# Altium schematic sheet board.SchDoc: Display & buttons board
size A3; Revision: 1; SheetNumber: 6; SheetTotal: 29
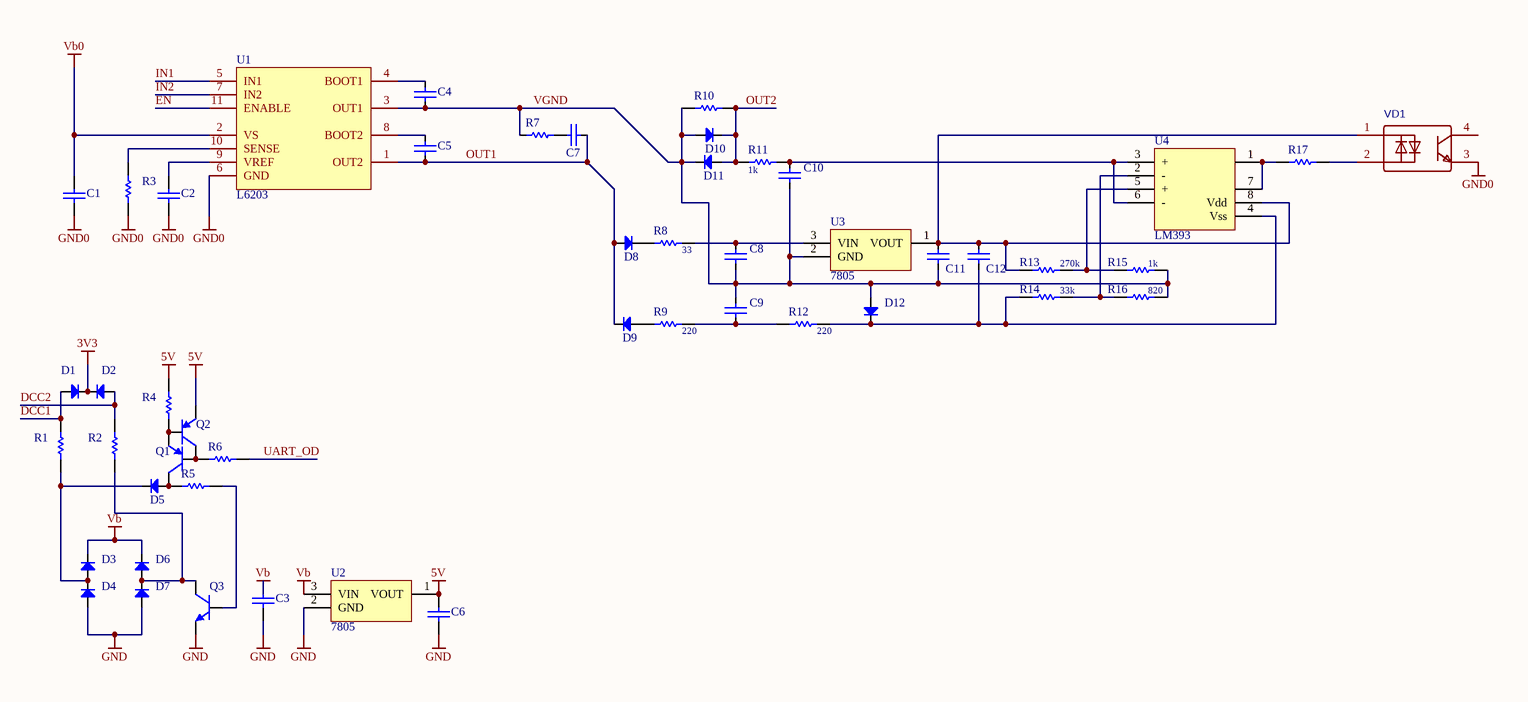
[diagram p0: board.SchDoc]

## Parts
C1  4n7  [C1210-2.5MM]  (value not drawn)
C2  4n7  [C0805]  (value not drawn)
C3  4n7  [C1210-2.5MM]  (value not drawn)
C4  15n  [C0805]  (value not drawn)
C5  15n  [C0805]  (value not drawn)
C6  4n7  [C1210-2.5MM]  (value not drawn)
C7  4n7  [C0805]  (value not drawn)
C8  2u  [C1210-1.8MM]  (value not drawn)
C9  2u  [C1210-1.8MM]  (value not drawn)
C10  100p  [C0603]  (value not drawn)
C11  10u  [C0805]  (value not drawn)
C12  10u  [C0805]  (value not drawn)
D1  1N4148WS  [SOD-323]  (value not drawn)
D2  1N4148WS  [SOD-323]  (value not drawn)
D3  1N4148WS  [SMA]  (value not drawn)
D4  1N4148WS  [SMA]  (value not drawn)
D5  1N4148WS  [SOD-323]  (value not drawn)
D6  1N4148WS  [SMA]  (value not drawn)
D7  1N4148WS  [SMA]  (value not drawn)
D8  1N4148WS  [SOD-323]  (value not drawn)
D9  1N4148WS  [SOD-323]  (value not drawn)
D10  SS36  [SMA]  (value not drawn)
D11  SS36  [SMA]  (value not drawn)
D12  1N4148WS  [SOD-323]  (value not drawn)
Q1  Bipolar PNP 3 Pins Transistor Gummel-Poon Model  [SOT-23]  (value not drawn)
Q2  Bipolar PNP 3 Pins Transistor Gummel-Poon Model  [SOT-23]  (value not drawn)
Q3  MMBT2222  [SOT-23]  (value not drawn)
R1  (no value)  [R0603]
R2  (no value)  [R0603]
R3  (no value)  [R1206]
R4  (no value)  [R0603]
R5  (no value)  [R0603]
R6  (no value)  [R0603]
R7  (no value)  [R1206]
R8  33  [R0603]
R9  220  [R0603]
R10  (no value)  [R1206]
R11  1k  [R0603]
R12  220  [R0603]
R13  270k  [R0603]
R14  33k  [R0603]
R15  1k  [R0603]
R16  820  [R0603]
R17  (no value)  [R0603]
U1  L6203  [MULTIWATT-11V_L19.6-W5.0-P1.70-L]
U2  7805  [SOT-89]
U3  7805  [SOT-89]
U4  LM393  [SO-8]
VD1  EL3H4(A)(TA)-VG  [SOP-4_L4.4-W2.8-P1.27-LS7.0-TL]  (value not drawn)

## Nets
3V3: D1.2(+) D2.2(+)
5V: C6.1 Q2.2(E) R4.1 U2.1(VOUT)
GND: C3.2 C6.2 D4.1(-) D7.1(-) Q3.2(E) U2.2(GND)
GND0: C1.2 C2.2 R3.2 U1.6(GND) VD1.3(Emitter)
Vb: C3.1 D3.2(+) D6.2(+) U2.3(VIN)
Vb0: C1.1 U1.2(VS)
DCC1: D1.1(-) R1.1
DCC2: D2.1(-) R2.1
EN: U1.11(ENABLE)
IN1: U1.5(IN1)
IN2: U1.7(IN2)
OUT1: C5.2 C7.1 D8.1(-) D9.2(+) U1.1(OUT2)
OUT2: D10.2(+) D11.1(-) R10.2 R11.2
UART_OD: R6.2
VGND: C4.2 C8.2 C9.1 C10.2 C11.2 D10.1(-) D11.2(+) D12.1(-) R7.2 R10.1 R15.2 R16.2 U1.3(OUT1) U3.2(GND)
NetC2_1: C2.1 U1.9(VREF)
NetC4_1: C4.1 U1.4(BOOT1)
NetC5_1: C5.1 U1.8(BOOT2)
NetC7_2: C7.2 R7.1
NetC8_1: C8.1 R8.2 U3.3(VIN)
NetC9_2: C9.2 R9.2 R12.1
NetC10_1: C10.1 R11.1 U4.3(+) U4.6(-)
NetC11_1: C11.1 C12.1 R13.2 U3.1(VOUT) U4.8(Vdd) VD1.1(Anode_/_Cathode)
NetC12_2: C12.2 D12.2(+) R12.2 R14.2 U4.4(Vss)
NetD3_1: D3.1(-) D4.2(+) D5.2(+) R1.2
NetD5_1: D5.1(-) Q1.3(C) R5.1
NetD6_1: D6.1(-) D7.2(+) Q3.3(C) R2.2
NetD8_2: D8.2(+) R8.1
NetD9_1: D9.1(-) R9.1
NetQ1_1: Q1.1(B) Q2.3(C) R6.1
NetQ1_2: Q1.2(E) Q2.1(B) R4.2
NetQ3_1: Q3.1(B) R5.2
NetR3_1: R3.1 U1.10(SENSE)
NetR13_1: R13.1 R15.1 U4.5(+)
NetR14_1: R14.1 R16.1 U4.2(-)
NetR17_1: R17.1 U4.1(OUT) U4.7(OUT)
NetR17_2: R17.2 VD1.2(Cathode_/_Anode)

Not connected (* = marked no-connect by the designer): VD1 4(Collector)

## Library data of the parts
C1-C7 C10 = CAP: 4n7 0402
C8 C9 C11 C12 = CAP
D1-D12 = NCP51460SN33T1G: P/N: SMCJ24A; LCSC part number: C693617
Q1 Q2 = BJT PNP GP
Q3 = MMBT2222ALT1G: LCSC part number: C82460; P/N: MMBT2222ALT1G
R1-R17 = RES: P/N: RC0402FR-0718KL; LCSC part number: C138044
U1 = L6203: Manufacturer: ST(意法半导体); Add into BOM: yes; Symbol: L6203; Device: L6203; LCSC Part Name: 48V电机驱动芯片; Supplier Part: C34306; Manufacturer Part: L6203; Supplier Footprint: Multiwatt-11-V; JLCPCB Part Class: Extended Part; Datasheet: https://atta.szlcsc.com/upload/public/pdf/source/20180808/C262899_7890AA609047E1172E0679C1326478CF.pdf; Supplier: LCSC; Convert to PCB: yes
U2 U3 = Component_4_1: XC6206P332MR